# EasyEDA Pro project EVA_RT.eprj, schematic VISION_2_X12_4S
Board Name: VISION_2_X12_4S; Create Date: 2025-01-23; Page Name: P1; Project Name: EVA_RT; Schematic Name: VISION_2_X12_4S; Update Date: 2025-01-23; Company: EasyEDA.com; Drawn: EasyEDA; Page Size: A4; Part Number: JLCPCB-002; Reviewed: EasyEDA; Version: V0.1
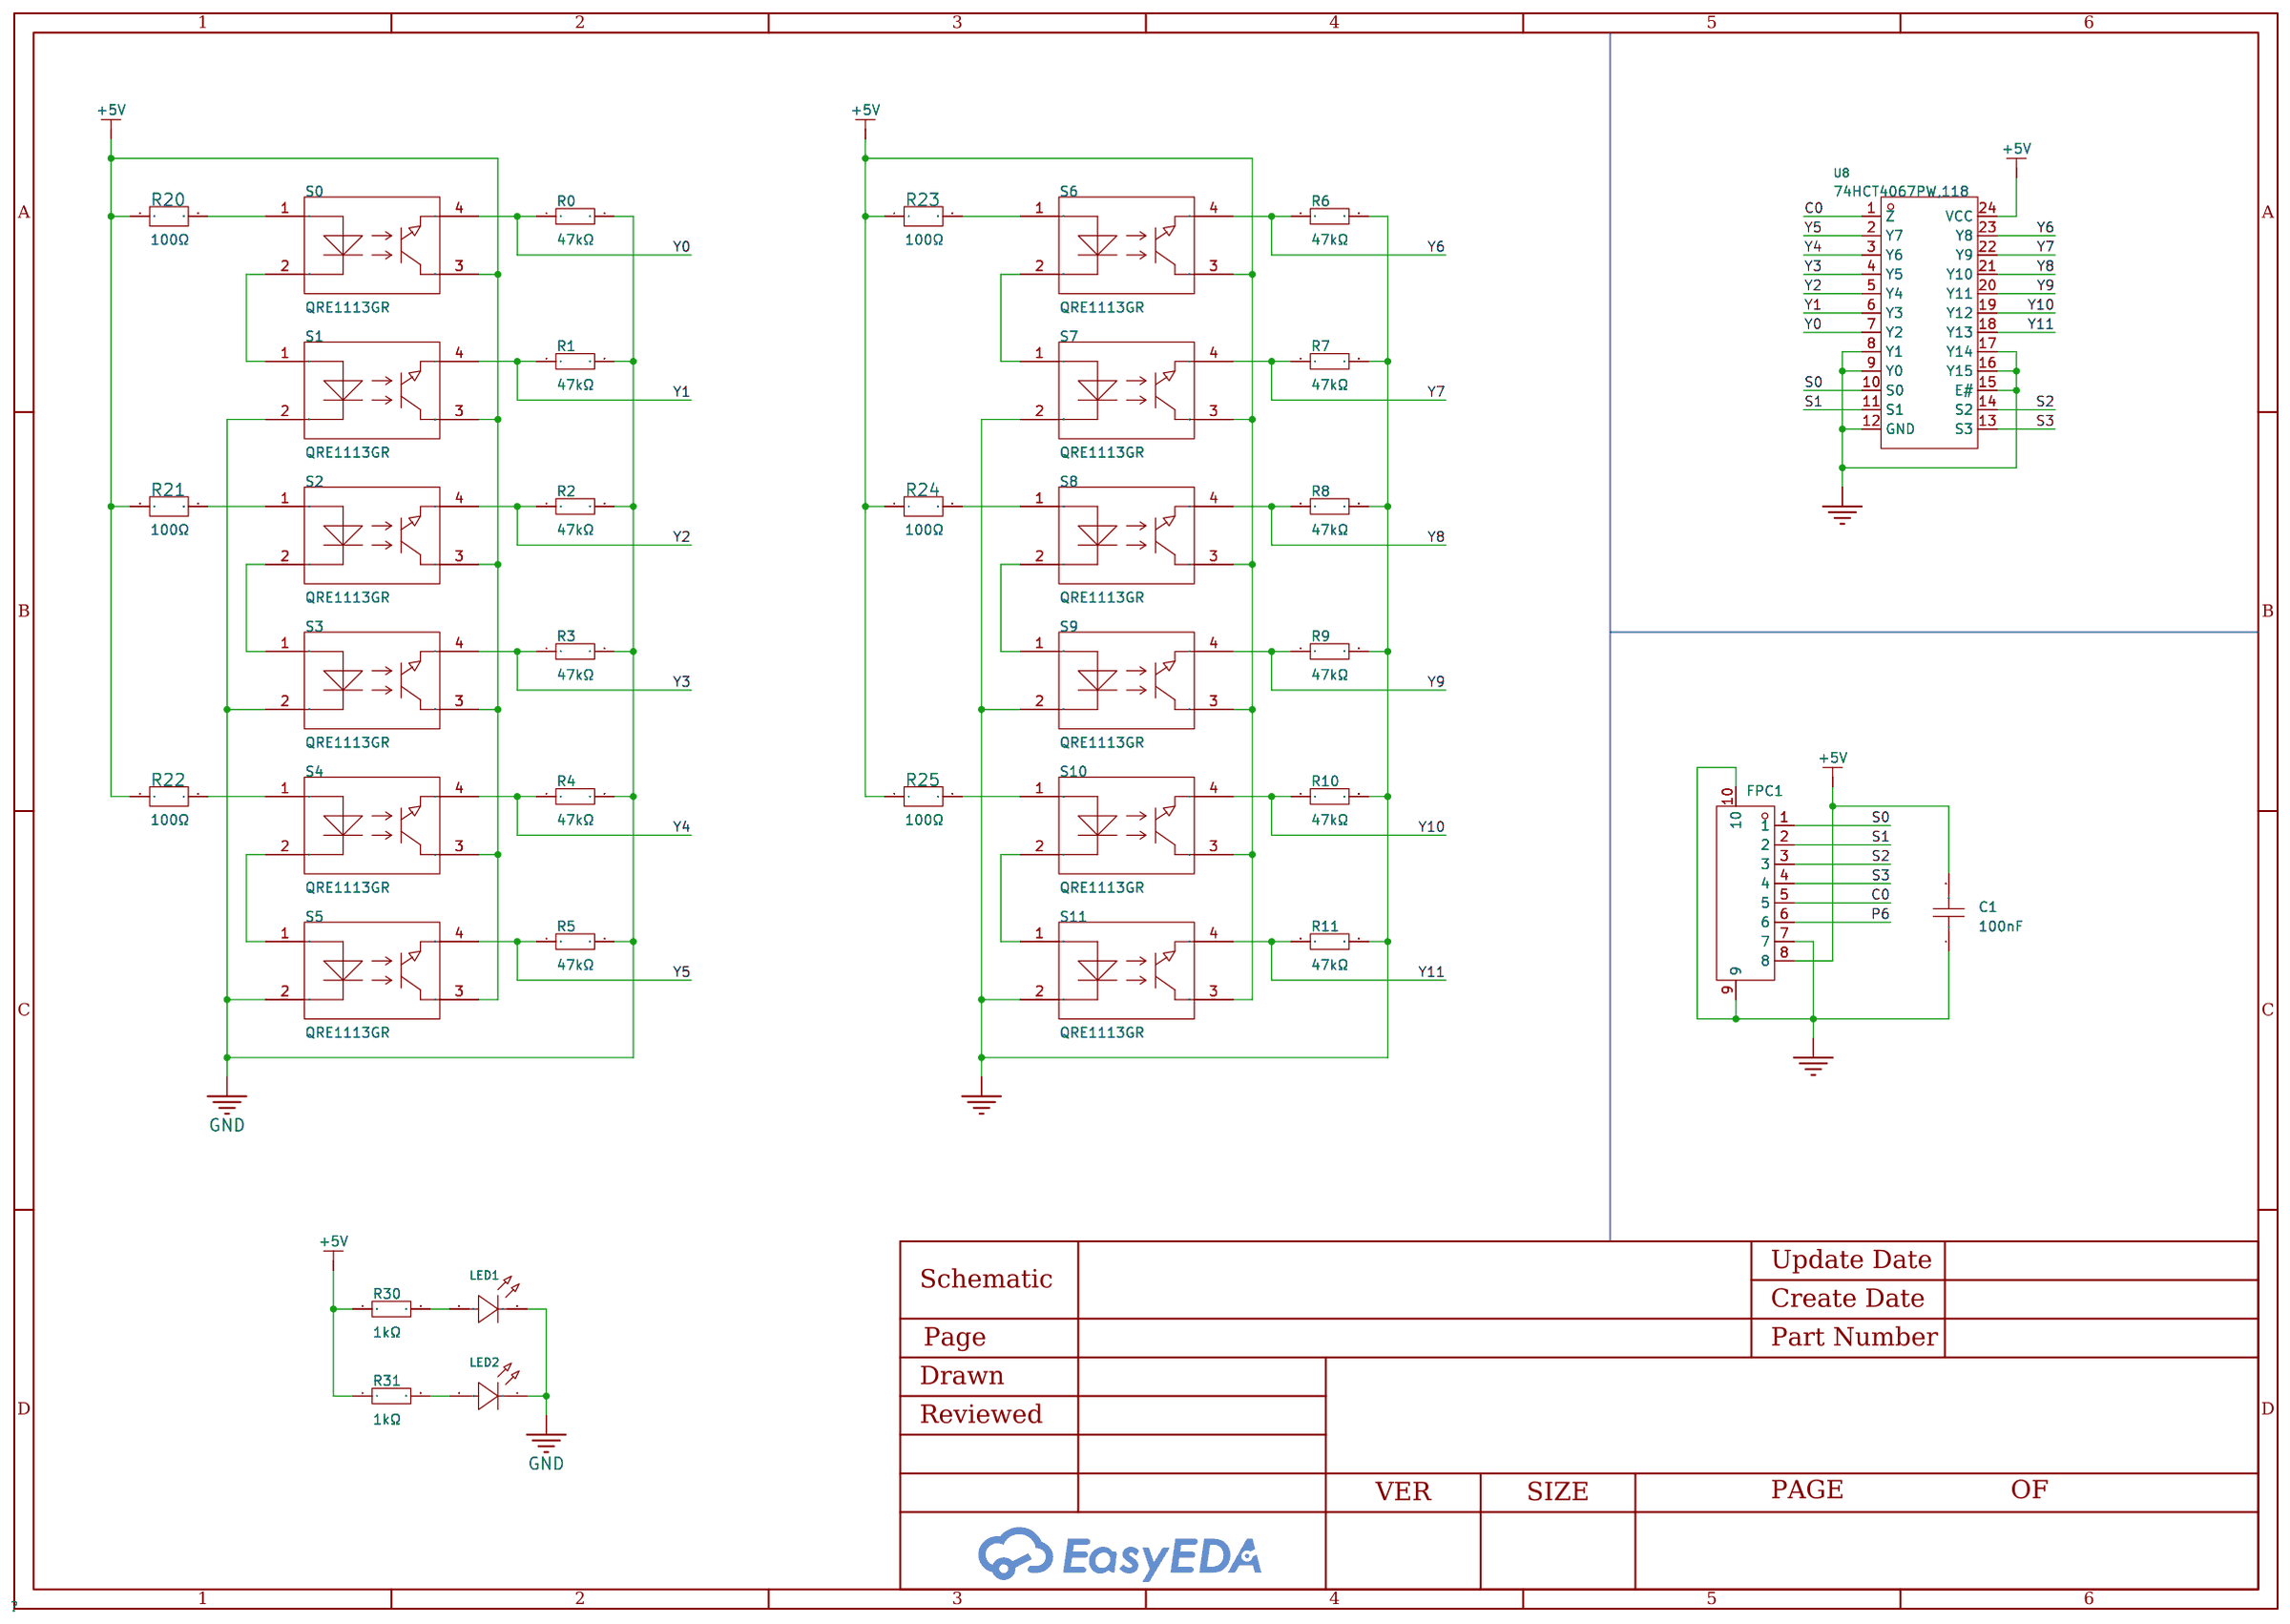
[diagram p0: schematic sheet]

## Parts
C1  100nF  [C0603]
FPC1  FFC05001-08SBA124W5M  [FFC-SMD_FFC05001-08SBA124W5M]
LED1  XL-1608SURC-06  [LED0603-RD_RED]
LED2  XL-1608SURC-06  [LED0603-RD_RED]
R0  47kΩ  [R0603]
R1  47kΩ  [R0603]
R2  47kΩ  [R0603]
R3  47kΩ  [R0603]
R4  47kΩ  [R0603]
R5  47kΩ  [R0603]
R6  47kΩ  [R0603]
R7  47kΩ  [R0603]
R8  47kΩ  [R0603]
R9  47kΩ  [R0603]
R10  47kΩ  [R0603]
R11  47kΩ  [R0603]
R20  100Ω  [R0603]
R21  100Ω  [R0603]
R22  100Ω  [R0603]
R23  100Ω  [R0603]
R24  100Ω  [R0603]
R25  100Ω  [R0603]
R30  1kΩ  [R0603]
R31  1kΩ  [R0603]
S0  QRE1113GR  [OPTO-SMD_QRE1113GR]
S1  QRE1113GR  [OPTO-SMD_QRE1113GR]
S2  QRE1113GR  [OPTO-SMD_QRE1113GR]
S3  QRE1113GR  [OPTO-SMD_QRE1113GR]
S4  QRE1113GR  [OPTO-SMD_QRE1113GR]
S5  QRE1113GR  [OPTO-SMD_QRE1113GR]
S6  QRE1113GR  [OPTO-SMD_QRE1113GR]
S7  QRE1113GR  [OPTO-SMD_QRE1113GR]
S8  QRE1113GR  [OPTO-SMD_QRE1113GR]
S9  QRE1113GR  [OPTO-SMD_QRE1113GR]
S10  QRE1113GR  [OPTO-SMD_QRE1113GR]
S11  QRE1113GR  [OPTO-SMD_QRE1113GR]
U8  74HCT4067PW,118  [TSSOP-24_L7.8-W4.4-P0.65-LS6.4-BL]

## Library data of the parts
C1 = C1608NP01H101JT000N: Capacitance: Tolerance:±5% Tolerance:±5% Voltage Rated: Temperature Coefficient:; LCSC Part Name: 100pF ±5% 50V; Supplier Part: C343033; Manufacturer: TDK; Supplier Footprint: 0603; JLCPCB Part Class: Extended Part; Datasheet: https://atta.szlcsc.com/upload/public/pdf/source/20190311/C343033_2C1C068BC0A68B1F01ED28762004C2DC.pdf; Supplier: LCSC; Tolerance: ±5%
FPC1 = FFC05001-08SBA124W5M: Locking Feature:抽屉式 Contact Type:Contact,Top Number of Contacts:8P Pitch:0.5mm Mounting Type:卧贴 FFC, FCB Thickness:0.3mm FFC, FCB Thickness:0.3mm Height Above Board:2mm; LCSC Part Name: 间距:0.5mm P数:8P 抽屉式 上接; Supplier Part: C456419; Manufacturer: TXGA(特思嘉); Supplier Footprint: SMD,P=0.5mm,卧贴; JLCPCB Part Class: Extended Part; Datasheet: https://atta.szlcsc.com/upload/public/pdf/source/20191118/C456760_2EA6D213D04401C3F6010DA75CB9EC31.pdf; Supplier: LCSC; Locking Feature: 抽屉式; Contact Type: Contact,Top; Number of Contacts: 8P; Pitch: 0.5mm; Mounting Type: 卧贴; FFC, FCB Thickness: 0.3mm; Height Above Board: 2mm
LED1 LED2 = XL-1608SURC-06: Emitted Color:Red Power Dissipation:55mW Forward Current:25mA Dominant Wavelength:617nm~621nm Dominant Wavelength:617nm~621nm Peak Wavelength:623nm Lens Color:无色透明透镜 Color Temperature:- Color Temperature:- Viewing Angle:120° Mounting Sytle:Positive post O; Supplier Part: C965799; Manufacturer: XINGLIGHT(成兴光); Supplier Footprint: 0603; JLCPCB Part Class: Extended Part; Datasheet: https://atta.szlcsc.com/upload/public/pdf/source/20221102/D860AFDD1CDB02C5A8064103A32707E2.pdf; Supplier: LCSC; Emitted Color: Red; Power Dissipation: 55mW; Forward Current: 25mA; Dominant Wavelength: 617nm~621nm; Peak Wavelength: 623nm; Lens Color: 无色透明透镜; Viewing Angle: 120°; Mounting Sytle: Positive post; Operating Temperature: -30℃~+85℃
R0-R11 = AC0603FR-0747KL: Type:Thick Film Resistors Resistance: Tolerance:±1% Tolerance:±1% Power(Watts): Temperature Coefficient:±100ppm/℃ Temperature Coefficient:±100ppm/℃ Overload Voltage (Max): Operating Temperature Range:-55℃~+155℃ Operating Temperature Range:-55℃~+155℃; LCSC Part Name: 47kΩ ±1% 100mW; Supplier Part: C111134; Manufacturer: YAGEO(国巨); Supplier Footprint: 0603; JLCPCB Part Class: Extended Part; Datasheet: https://atta.szlcsc.com/upload/public/pdf/source/20171221/C111134_15138309997331195189.pdf; Supplier: LCSC; Type: Thick Film Resistors; Tolerance: ±1%; Temperature Coefficient: ±100ppm/℃; Operating Temperature Range: -55℃~+155℃
R20-R25 = SCR0603J100R: Resistance: Tolerance:±5% Tolerance:±5%; LCSC Part Name: 100Ω ±5%; Supplier Part: C3017758; Manufacturer: VO(翔胜); Supplier Footprint: 0603; JLCPCB Part Class: Extended Part; Datasheet: https://atta.szlcsc.com/upload/public/pdf/source/20220513/247AF9639BA21CF93567DC289CCC6A22.pdf; Supplier: LCSC; Tolerance: ±5%
R30 R31 = RC0603FR-071KL: Type:Thick Film Resistors Resistance: Tolerance:±1% Tolerance:±1% Power(Watts): Overload Voltage (Max): Temperature Coefficient:±100ppm/℃ Temperature Coefficient:±100ppm/℃ Operating Temperature Range:-55℃~+155℃ Operating Temperature Range:-55℃~+155℃; LCSC Part Name: 厚膜电阻 1kΩ ±1% 100mW; Supplier Part: C22548; Manufacturer: YAGEO(国巨); Supplier Footprint: 0603; JLCPCB Part Class: Extended Part; Datasheet: https://atta.szlcsc.com/upload/public/pdf/source/20180316/70C0E2BDAE7FCC62C531A5A58D202EE1.pdf; Supplier: LCSC; Type: Thick Film Resistors; Tolerance: ±1%; Temperature Coefficient: ±100ppm/℃; Operating Temperature Range: -55℃~+155℃
S0-S11 = QRE1113GR: Supplier Part: C232862; Manufacturer: onsemi(安森美); Supplier Footprint: SMD-4P; JLCPCB Part Class: Extended Part; Datasheet: https://atta.szlcsc.com/upload/public/pdf/source/20221020/4EA8EB874547A092CF9AAECC2DF94CC1.pdf; Supplier: LCSC
U8 = 74HCT4067PW,118: Switch Circuit:- Number of Channels:1 Supply Voltage:4.5V~5.5V Supply Voltage:4.5V~5.5V Turn-on time:65ns On-State Resistance (Max):120Ω Turn-off time:60ns; Supplier Part: C547734; Manufacturer: Nexperia(安世); Supplier Footprint: TSSOP-24; JLCPCB Part Class: Extended Part; Datasheet: https://atta.szlcsc.com/upload/public/pdf/source/20200702/C547033_5DBE81022979392AE07475BA2948666F.pdf; Supplier: LCSC; Number of Channels: 1; Supply Voltage: 4.5V~5.5V; Turn-on time: 65ns; On-State Resistance (Max): 120Ω; Turn-off time: 60ns

## Nets
+5V: C1.2 FPC1.8 R20.1 R21.1 R22.1 R23.1 R24.1 R25.1 R30.1 R31.1 S0.3 S1.3 S2.3 S3.3 S4.3 S5.3 S6.3 S7.3 S8.3 S9.3 S10.3 S11.3 U8.24(VCC)
GND: C1.1 FPC1.7 FPC1.9 FPC1.10 LED1.1(K) LED2.1(K) R0.2 R1.2 R2.2 R3.2 R4.2 R5.2 R6.2 R7.2 R8.2 R9.2 R10.2 R11.2 S1.2 S3.2 S5.2 S7.2 S9.2 S11.2 U8.8(Y1) U8.9(Y0) U8.12(GND) U8.15(E#) U8.16(Y15) U8.17(Y14)
C0: FPC1.5 U8.1(Z)
P6: FPC1.6
S0: FPC1.1 U8.10(S0)
S1: FPC1.2 U8.11(S1)
S2: FPC1.3 U8.14(S2)
S3: FPC1.4 U8.13(S3)
Y0: R0.1 S0.4 U8.7(Y2)
Y1: R1.1 S1.4 U8.6(Y3)
Y2: R2.1 S2.4 U8.5(Y4)
Y3: R3.1 S3.4 U8.4(Y5)
Y4: R4.1 S4.4 U8.3(Y6)
Y5: R5.1 S5.4 U8.2(Y7)
Y6: R6.1 S6.4 U8.23(Y8)
Y7: R7.1 S7.4 U8.22(Y9)
Y8: R8.1 S8.4 U8.21(Y10)
Y9: R9.1 S9.4 U8.20(Y11)
Y10: R10.1 S10.4 U8.19(Y12)
Y11: R11.1 S11.4 U8.18(Y13)
$LED1_2: LED1.2(A) R30.2
$LED2_2: LED2.2(A) R31.2
$R20_2: R20.2 S0.1
$R21_2: R21.2 S2.1
$R22_2: R22.2 S4.1
$R23_2: R23.2 S6.1
$R24_2: R24.2 S8.1
$R25_2: R25.2 S10.1
$S0_2: S0.2 S1.1
$S2_2: S2.2 S3.1
$S4_2: S4.2 S5.1
$S6_2: S6.2 S7.1
$S8_2: S8.2 S9.1
$S10_2: S10.2 S11.1
